# EAGLE board kicker (EAGLE 9.6.2)
VERSION: v4.0
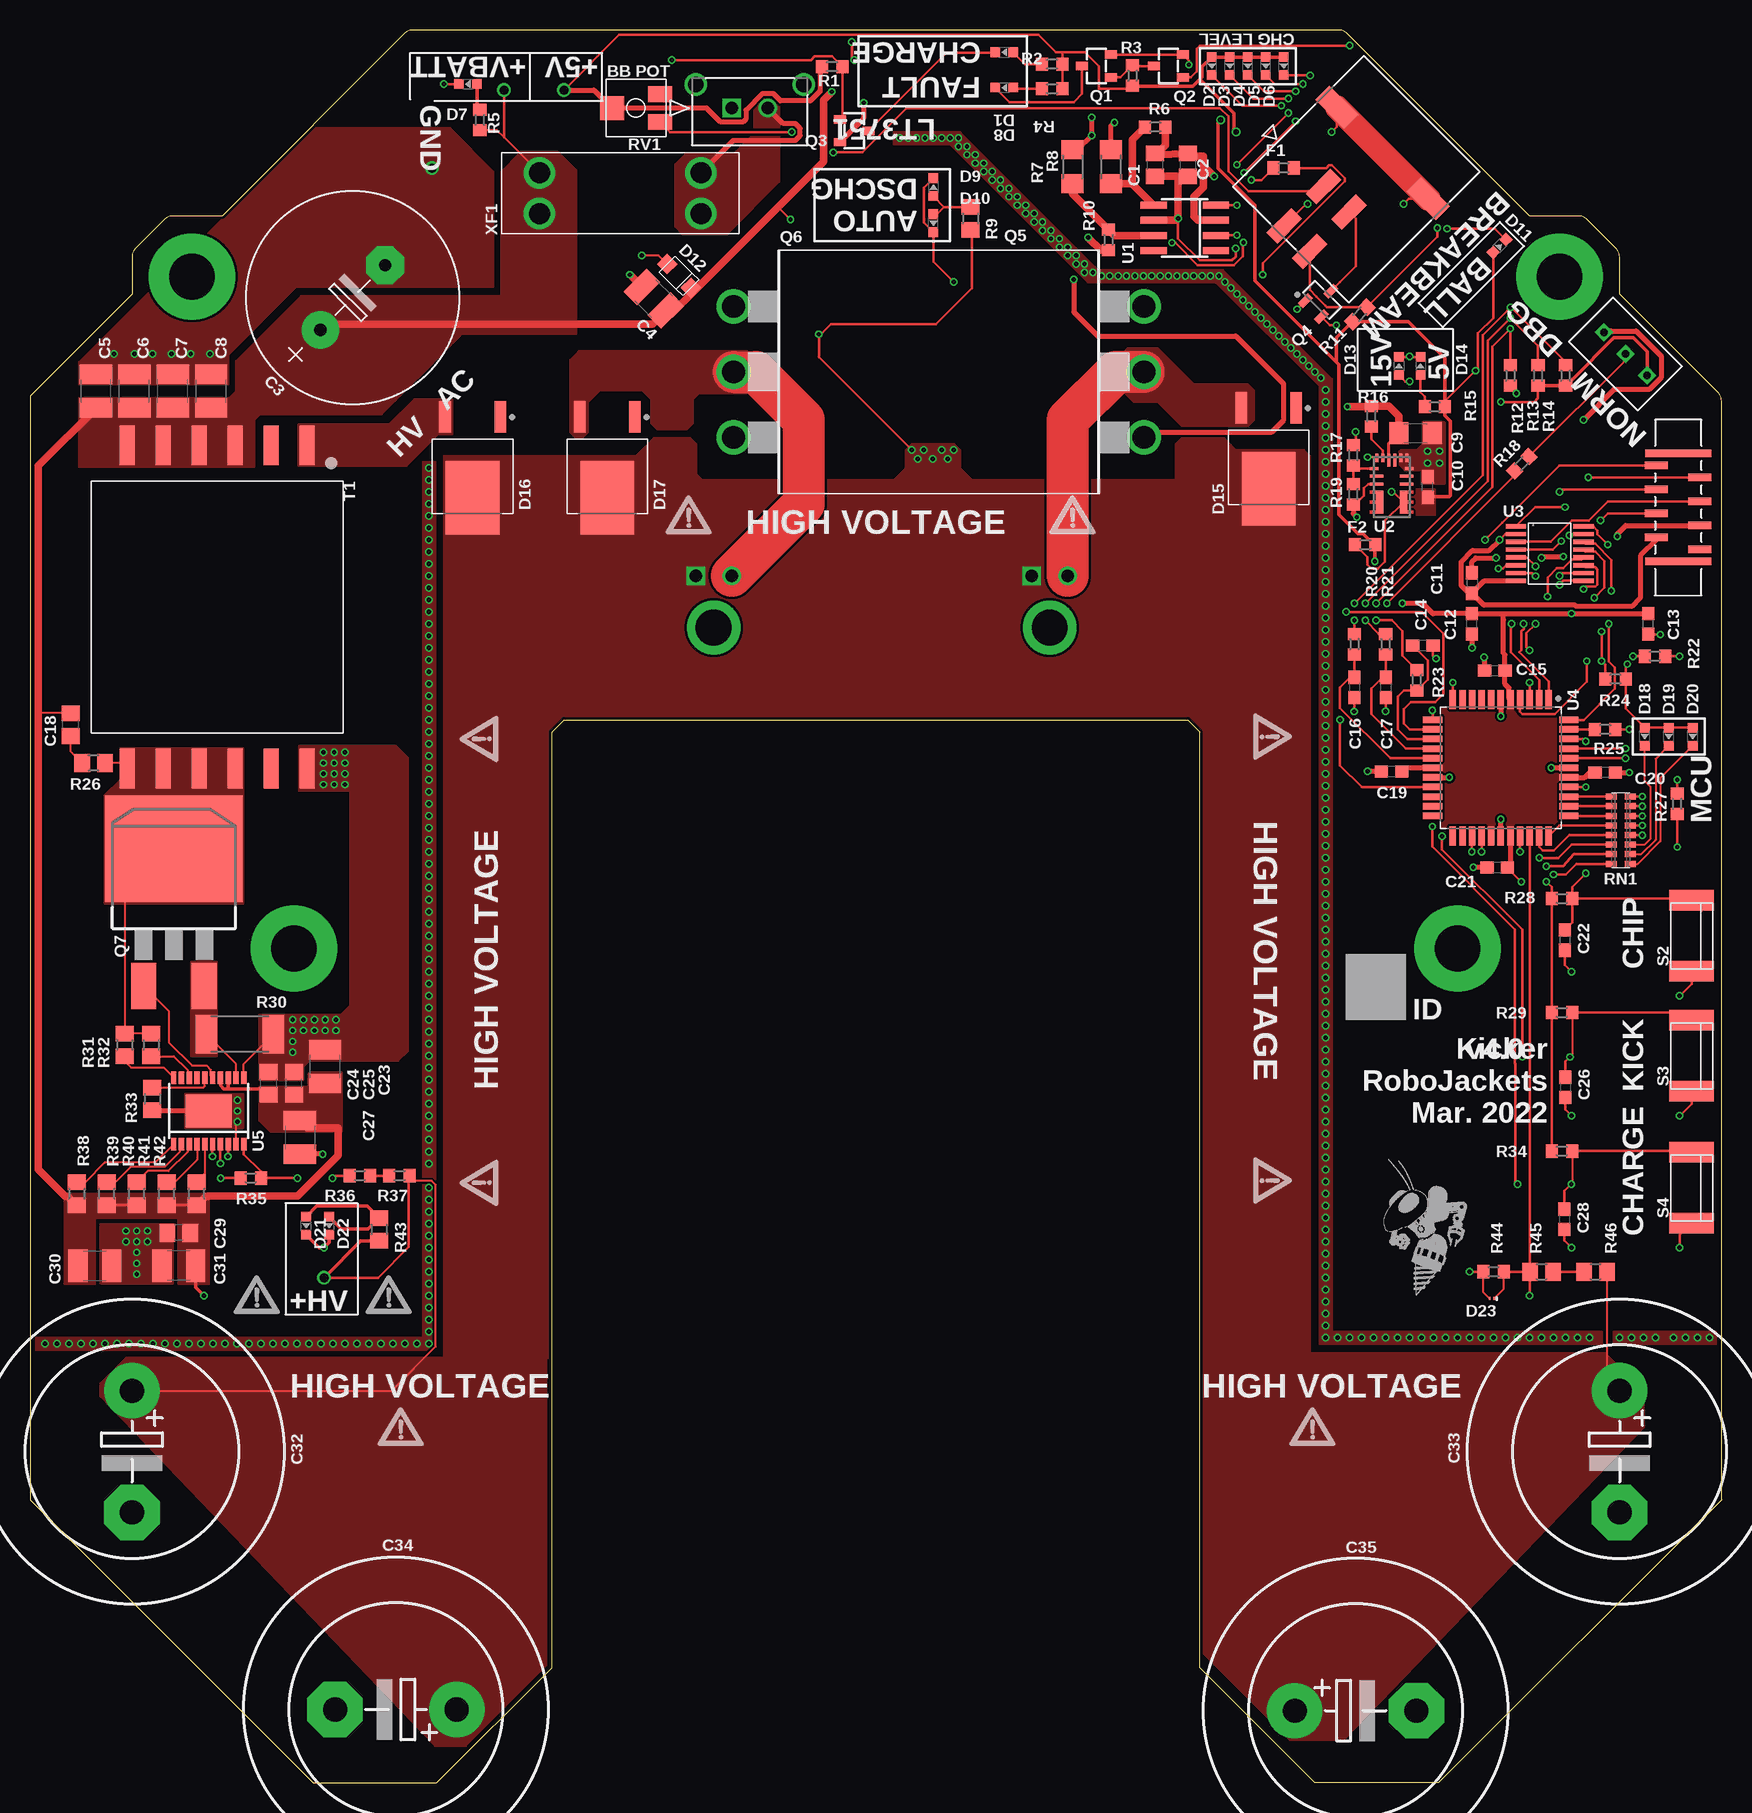
[diagram p9: board, top side]
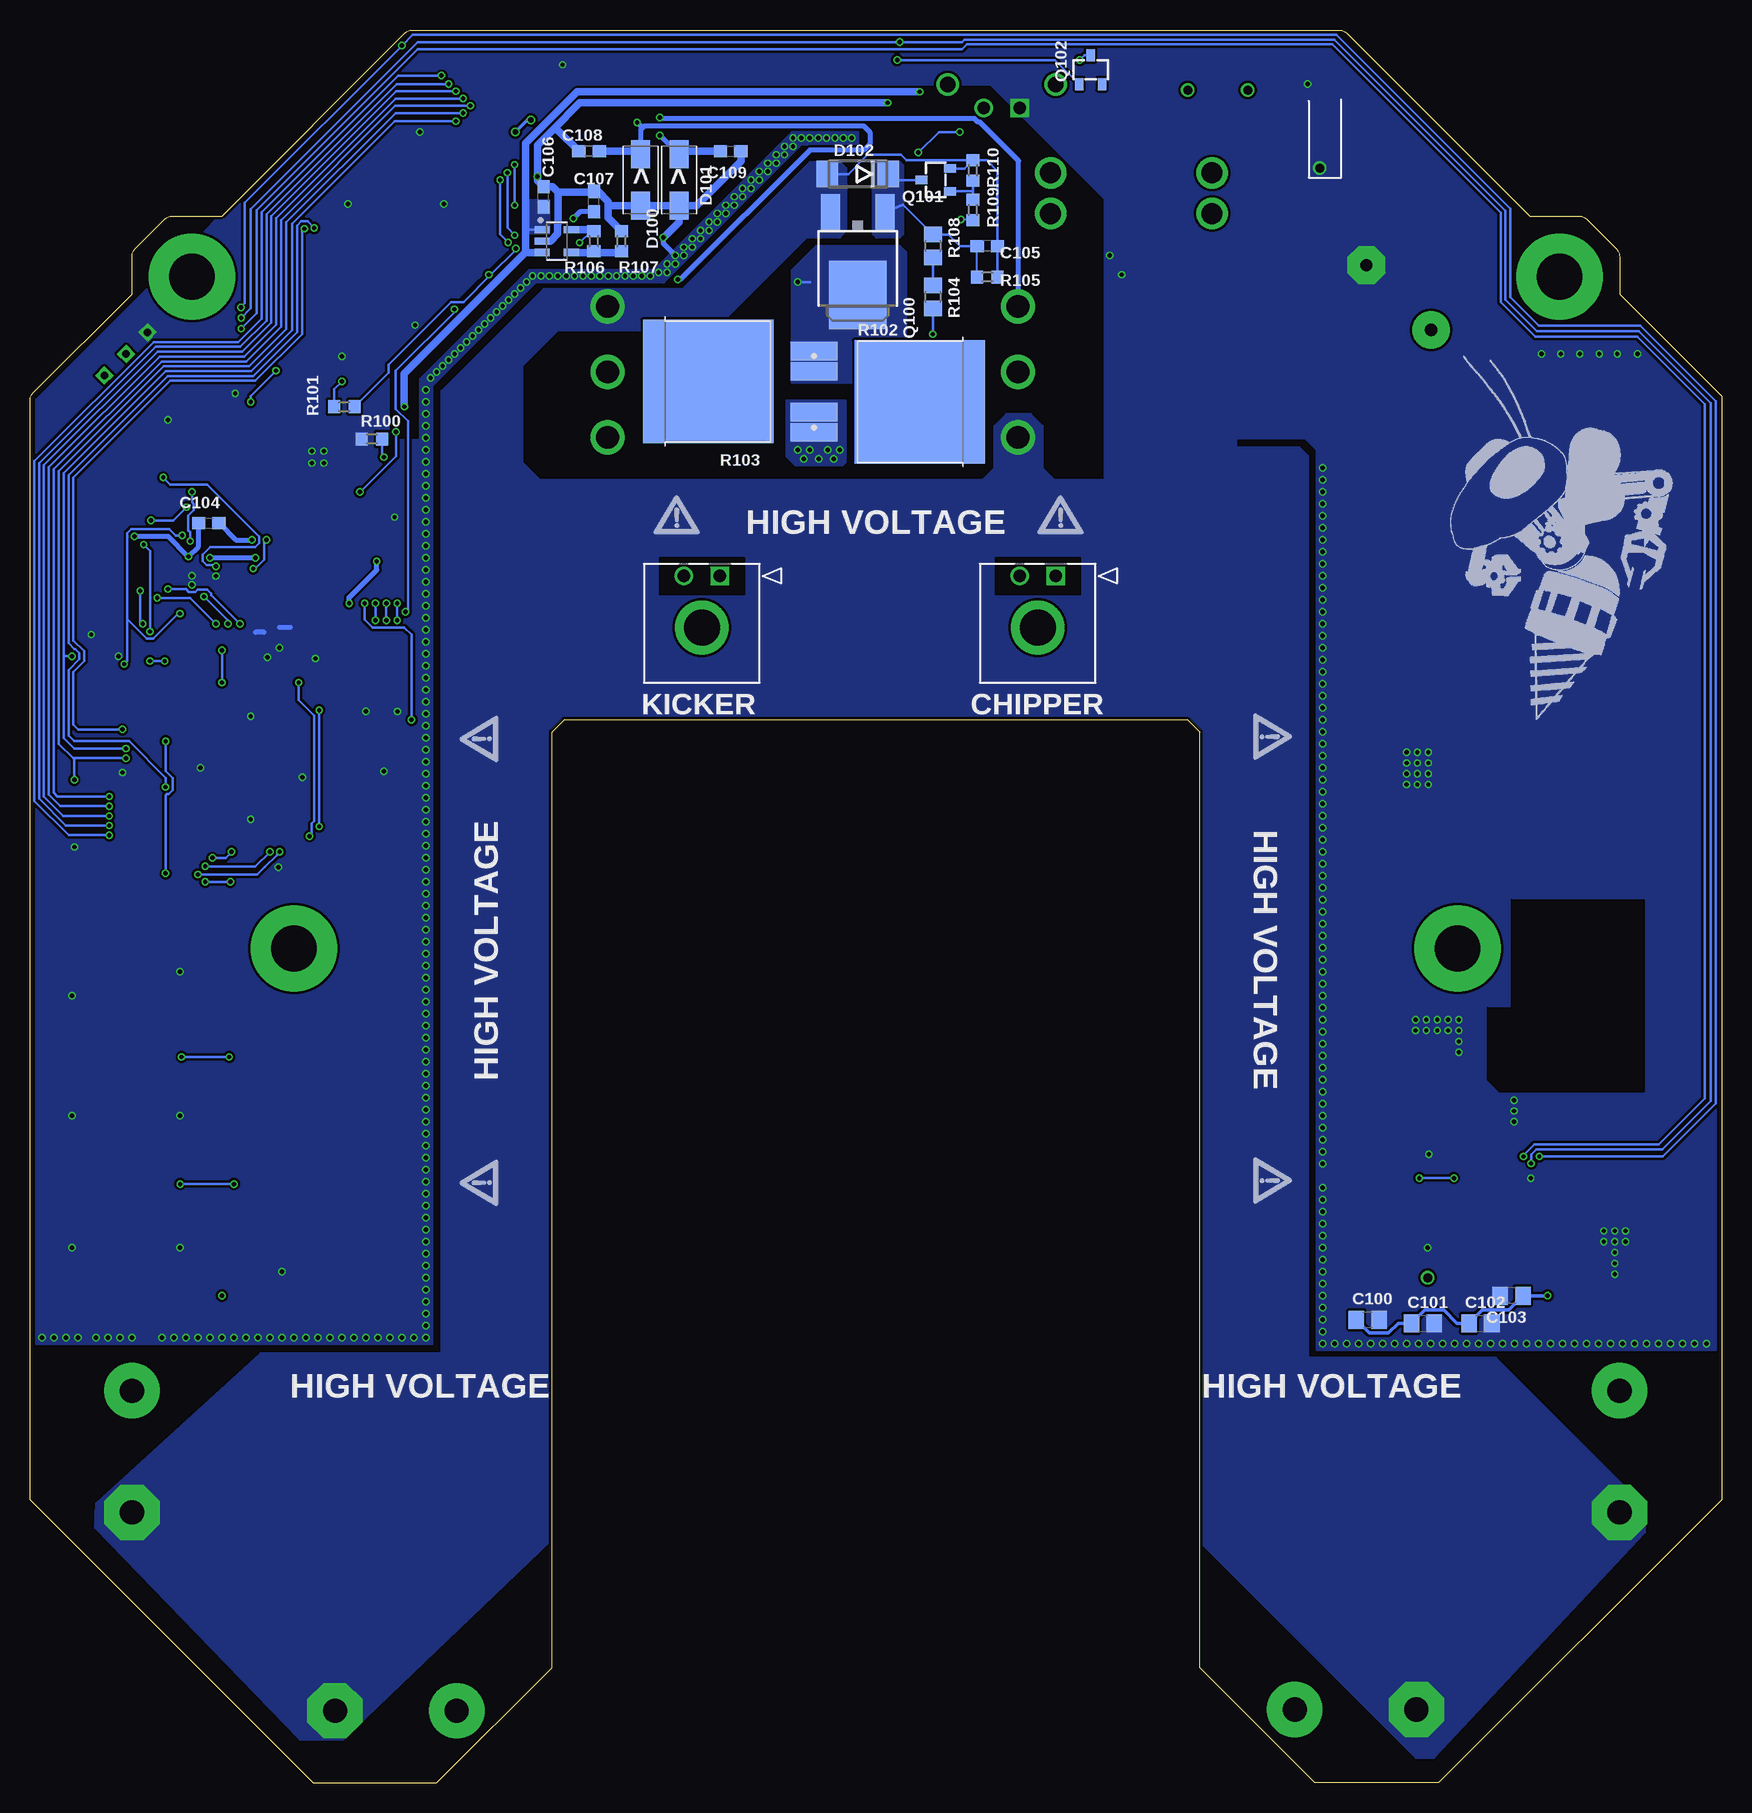
[diagram p10: board, bottom side, seen from below]

Size 141 x 146.1 mm. Coordinates in mm from the lower left corner, seen from the top.
Outline: 44.5,88.6 96.5,88.6 97.5,87.6 97.5,9.6 107.1,0 117.4,0 141,23.6 141,115.19 arc45 140.71,115.89 132.5,124.1 132.5,127.19 arc45 132.21,127.89 129.79,130.31 arc45 129.09,130.6 125,130.6 109.79,145.81 arc45 109.09,146.1 31.91,146.1 arc45 31.21,145.81 16,130.6 11.91,130.6 arc45 11.21,130.31 8.79,127.89 arc45 8.5,127.19 8.5,124.1 0,115.6 0,23.6 23.6,0 33.9,0 43.5,9.6 43.5,87.6 44.5,88.6
Copper layers (1*16): Top 0.018mm / dielectric 1.55mm / Bottom 0.018mm
Design rules "eC_2Layer_PClass6_BaseCopperO18_eCDefault": minimum track width 0.15mm, minimum drill 0.35mm, track to track 0.15mm, track to pad 0.15mm, pad to pad 0.15mm, via to via 0.15mm, smd to smd 0mil, copper to edge 0.25mm, drill to drill 0.35mm, minimum pad ring 0.175mm, minimum via ring 0.125mm, stop-mask expansion 0mil, vias tented up to drill 0.45mm, thermal gap 0.2mm
Net classes: 0 default: clearance 0.205 mm
vRestrict: area 18.2,65.8 to 25.8,73.3; area 115.2,65.8 to 122.8,73.3; area 9.8,121.8 to 17.2,129.3; area 123.8,121.8 to 131.2,129.3

## Footprints (pad centres in the part's own frame; a part is rotated, then mirrored left to right if it is on the bottom)
C0805 = smd 1.3 x 1.5: 1 -0.95,0; 2 0.95,0
E7,5-18 = drill 1.016 pad 3.15: + -3.81,0 | drill 1.016 pad 3.15 octagon: - 3.81,0
C1210 = smd 1.6 x 2.7: 1 -1.4,0; 2 1.4,0
C1206 = smd 1.6 x 1.8: 1 -1.4,0; 2 1.4,0
C0603 = smd 1.1 x 1: 1 -0.85,0; 2 0.85,0
EB25D = drill 2.007 pad 4.597: + -5.08,0 | drill 2.007 pad 4.597 octagon: - 5.08,0
CHIP-LED0603 = smd 0.8 x 0.8: A 0,-0.75; C 0,0.75
SOD123-W = smd 1.2 x 1.2: A 1.4,0; C -1.4,0
TO460P990X239-3 = smd 2.634 x 0.974: 1 -4.241,2.3; 2 -4.241,-2.3 | smd 6.101 x 4.492: 3 2.507,0
DSN0603-2 = smd 0.15 x 0.25: C1 -0.2,0; C2 0.2,0
RESM5226X262 = smd 2.316 x 1.565: 1 -2.141,0; 2 2.141,0
DO214AA = smd 1.8 x 2.2: A 2.55,0; C -2.55,0
F0603 = smd 1 x 1.1: 1 -0.85,0; 2 0.85,0
CON_436500217_MOL = drill 1.016 pad 1.524 square: 1 0,0 | drill 1.016 pad 1.524: 2 -2.997,0 | drill 1.27 pad 1.27: M1 2.997,-1.956; M2 -5.994,-1.956
CON_430450411_MOL = smd 1.27 x 2.92: 1 1.5,5.115; 2 -1.5,5.115; 3 1.5,9.745; 4 -1.5,9.745 | smd 3.43 x 1.65: S1 5.375,-0.355; S2 -5.395,-0.355
CON8_1X8_UB_SFW_JAE = smd 0.61 x 1.905: 1 0,0; 2 1,3.65; 3 2,0; 4 3,3.65; 5 4,0; 6 5,3.65; 7 6,0; 8 7,3.65 | smd 0.61 x 5.512: NC1 -1,1.803; NC2 8,1.803
CON_436500202_MOL = drill 1.016 pad 1.524 square: 1 0,0 | drill 1.016 pad 1.524: 2 -2.997,0 | drill 2.997 pad 2.997: M1 -1.499,-4.318
SOT-23-3 = smd 0.7 x 1: 1 -0.95,-1.2; 2 0.95,-1.2; 3 0,1.2
SOT95P240X110-3 = smd 1.18 x 0.609: 1 -1.024,0.95; 2 -1.024,-0.95; 3 1.024,0
TO264 = drill 1.905: C_BOT 0,-6.35; E_BOT 5.461,-6.35; G_BOT -5.461,-6.35
D2PAK = smd 2.083 x 3.81: 1 -2.54,-8.89; 3 2.54,-8.89 | smd 11.43 x 8.89: 2 0,2.54
DPAK = smd 1.6 x 3: 1 -2.28,-5.31; 3 2.28,-5.31 | smd 4.826 x 5.715: 4 0,1.588
R0603 = smd 1 x 1.1: 1 -0.85,0; 2 0.85,0
R1206 = smd 1.6 x 1.803: 1 -1.422,0; 2 1.422,0
R0805 = smd 1.3 x 1.5: 1 -0.95,0; 2 0.95,0
R2512 = smd 1.8 x 3.2: 1 -2.8,0; 2 2.8,0
TO508P1539X450-3 = smd 3.912 x 1.572: 1 -6.145,2.54; 2 -6.145,-2.54 | smd 10.892 x 10.272: 3 2.655,0
RA-8_2506 = smd 0.5 x 0.9: 1 -2.8,-0.8; 2 -2,-0.8; 3 -1.2,-0.8; 4 -0.4,-0.8; 5 0.4,-0.8; 6 1.2,-0.8; 7 2,-0.8; 8 2.8,-0.8; 9 2.8,0.8; 10 2,0.8; 11 1.2,0.8; 12 0.4,0.8; 13 -0.4,0.8; 14 -1.2,0.8; 15 -2,0.8; 16 -2.8,0.8
3214J = smd 1.3 x 2: P$1 1.15,-2; P$3 -1.15,-2 | smd 2 x 2: P$2 0,2
TT11EGPC1 = drill 0.6 pad 1.09 square: 1 -2.54,0; 2 2.54,0; 3 0,0
KSS32 = smd 1.7 x 3.7: 1 -2.95,0; 2 2.95,0
DA2034 = smd 3.3 x 1.27: 1 -13.46,7.5; 2 -13.46,4.5; 3 -13.46,1.5; 4 -13.46,-1.5; 5 -13.46,-4.5; 6 -13.46,-7.5; 7 13.46,-7.5; 8 13.46,-4.5; 9 13.46,-1.5; 10 13.46,1.5; 11 13.46,4.5; 12 13.46,7.5
SOIC-8 = smd 0.6 x 2.2: 1 -1.905,-2.6; 2 -0.635,-2.6; 3 0.635,-2.6; 4 1.905,-2.6; 5 1.905,2.6; 6 0.635,2.6; 7 -0.635,2.6; 8 -1.905,2.6
MPM3620GQV-P = smd 0.7 x 0.25: 1 -1.45,1.55; 12 1.45,1.55 | smd 1.1 x 0.25: 2 -1.25,0.9; 3 -1.25,0.25; 10 1.25,0.25; 11 1.25,0.9 | smd 0.25 x 0.7: 13 1.25,2.45; 14 0.75,2.45; 17 -0.75,2.45; 18 -1.25,2.45 | smd 0.25 x 1.1: 15 0.25,2.25; 16 -0.25,2.25 | smd 0.6 x 1.95: 456 -1,-1.25; 789 1,-1.25
PW16 = smd 1.676 x 0.356: 1 -2.819,2.275; 2 -2.819,1.625; 3 -2.819,0.975; 4 -2.819,0.325; 5 -2.819,-0.325; 6 -2.819,-0.975; 7 -2.819,-1.625; 8 -2.819,-2.275; 9 2.819,-2.275; 10 2.819,-1.625; 11 2.819,-0.975; 12 2.819,-0.325; 13 2.819,0.325; 14 2.819,0.975; 15 2.819,1.625; 16 2.819,2.275
QFP80P1200X1200X120-44 = smd 1.6 x 0.547: 1 -5.681,4; 2 -5.681,3.2; 3 -5.681,2.4; 4 -5.681,1.6; 5 -5.681,0.8; 6 -5.681,0; 7 -5.681,-0.8; 8 -5.681,-1.6; 9 -5.681,-2.4; 10 -5.681,-3.2; 11 -5.681,-4; 23 5.681,-4; 24 5.681,-3.2; 25 5.681,-2.4; 26 5.681,-1.6; 27 5.681,-0.8; 28 5.681,0; 29 5.681,0.8; 30 5.681,1.6; 31 5.681,2.4; 32 5.681,3.2; 33 5.681,4 | smd 0.547 x 1.6: 12 -4,-5.681; 13 -3.2,-5.681; 14 -2.4,-5.681; 15 -1.6,-5.681; 16 -0.8,-5.681; 17 0,-5.681; 18 0.8,-5.681; 19 1.6,-5.681; 20 2.4,-5.681; 21 3.2,-5.681; 22 4,-5.681; 34 4,5.681; 35 3.2,5.681; 36 2.4,5.681; 37 1.6,5.681; 38 0.8,5.681; 39 0,5.681; 40 -0.8,5.681; 41 -1.6,5.681; 42 -2.4,5.681; 43 -3.2,5.681; 44 -4,5.681
TSSOP-20_EP = smd 1.05 x 0.45: 1 -2.775,2.925; 2 -2.775,2.275; 3 -2.775,1.625; 4 -2.775,0.975; 5 -2.775,0.325; 6 -2.775,-0.325; 7 -2.775,-0.975; 8 -2.775,-1.625; 9 -2.775,-2.275; 10 -2.775,-2.925; 11 2.775,-2.925; 12 2.775,-2.275; 13 2.775,-1.625; 14 2.775,-0.975; 15 2.775,-0.325; 16 2.775,0.325; 17 2.775,0.975; 18 2.775,1.625; 19 2.775,2.275; 20 2.775,2.925 | smd 2.74 x 3.86: PAD 0,0
SOT95P280X145-5 = smd 1.259 x 0.609: 1 -1.228,0.95; 2 -1.228,0; 3 -1.228,-0.95; 4 1.228,-0.95; 5 1.228,0.95
3557-2 = drill 1.75: 1 -6.735,1.7; 2 -6.735,-1.7; 3 6.735,-1.7; 4 6.735,1.7

## Placement (x,y rotation side)
C1  22uF 35V  [C0805]  93.75,134.85 270 top
C2  0.1uF 35V  [C0805]  96.5,134.85 270 top
C3  560uF  [E7,5-18]  26.9,123.8 45 top
C4  10uF  [C1210]  52,123.7 135 top
C5  10uF  [C1210]  5.5,116 90 top
C6  10uF  [C1210]  8.7,116 90 top
C7  10uF  [C1210]  11.9,116 90 top
C8  10uF  [C1210]  15.1,116 90 top
C9  10uF 50V  [C1206]  115.5,112.5 0 top
C10  22uF 10V  [C0603]  116.5,108 90 top
C11  0.1uF  [C0603]  120.2,100 270 top
C12  0.1uF  [C0603]  120.2,96.6 90 top
C13  0.1uF  [C0603]  134.9,96.6 90 top
C14  1uF  [C0603]  116.1,94.8 0 top
C15  0.1uF  [C0603]  122.1,92.7 0 top
C16  1uF  [C0603]  110.4,91.3 270 top
C17  1uF  [C0603]  113,91.3 270 top
C18  220pF 100V  [C0805]  3.4,88.2 90 top
C19  0.1uF  [C0603]  113.5,84.3 0 top
C20  0.1uF  [C0603]  131.3,84.2 180 top
C21  0.1uF  [C0603]  122.3,76.3 0 top
C22  0.1uF  [C0603]  127.94,70.24 270 top
C23  10uF (X7R) 35V  [C1210]  24.6,59.7 90 top
C24  0.1uF 35V  [C0805]  19.9,58.3 90 top
C25  0.1uF 35V  [C0805]  22,58.3 90 top
C26  0.1uF  [C0603]  127.98,57.96 270 top
C27  10uF (X7R) 35V  [C1210]  22.5,53.8 270 top
C28  0.1uF  [C0603]  127.9,46.96 270 top
C29  0.1uF 35V  [C0805]  12.4,45.85 180 top
C30  10uF (X7R) 35V  [C1210]  5.4,43.1 0 top
C31  10uF (X7R) 35V  [C1210]  12.4,43.1 180 top
C32  820uF  [EB25D]  8.5,27.6 270 top
C33  820uF  [EB25D]  132.5,27.6 270 top
C34  820uF  [EB25D]  30.5,6.1 180 top
C35  820uF  [EB25D]  110.5,6 0 top
C100  0.1uF 35V  [C0805]  29.5,38.6 0 bottom
C101  1uF 35V  [C0805]  24.9,38.3 0 bottom
C102  1uF 35V  [C0805]  20.1,38.3 0 bottom
C103  0.1uF 35V  [C0805]  17.5,40.6 180 bottom
C104  0.1uF  [C0603]  126.1,105 0 bottom
C105  0.1uF 35V  [C0603]  61.2,128.1 180 bottom
C106  1uF 50V  [C0603]  98.2,132.2 90 bottom
C107  2.2uF 35V  [C0603]  94,131.8 90 bottom
C108  0.1uF 35V  [C0603]  94.4,136 180 bottom
C109  0.1uF 35V  [C0603]  82.6,136 0 bottom
D1  GREEN  [CHIP-LED0603]  81.2,144.25 90 top
D2  RED  [CHIP-LED0603]  98.5,143.1 180 top
D3  RED  [CHIP-LED0603]  100,143.1 180 top
D4  YELLOW  [CHIP-LED0603]  101.5,143.1 180 top
D5  YELLOW  [CHIP-LED0603]  103,143.1 180 top
D6  GREEN  [CHIP-LED0603]  104.5,143.1 180 top
D7  GREEN  [CHIP-LED0603]  36.5,141.6 90 top
D8  RED  [CHIP-LED0603]  81.2,141.3 90 top
D9  YELLOW  [CHIP-LED0603]  75.3,133 0 top
D10  YELLOW  [CHIP-LED0603]  75.3,130 180 top
D11  BLUE  [CHIP-LED0603]  122.5,128.1 315 top
D12  PTVS20VS1UR  [SOD123-W]  54.1,125.6 135 top
D13  GREEN  [CHIP-LED0603]  114.1,118.1 0 top
D14  GREEN  [CHIP-LED0603]  115.9,118.1 0 top
D15  GD10MPS12E  [TO460P990X239-3]  103.25,110.35 270 top
D16  GD10MPS12E  [TO460P990X239-3]  36.9,109.6 270 top
D17  GD10MPS12E  [TO460P990X239-3]  48.12,109.6 270 top
D18  GREEN  [CHIP-LED0603]  134.6,87.2 180 top
D19  YELLOW  [CHIP-LED0603]  136.6,87.2 180 top
D20  RED  [CHIP-LED0603]  138.6,87.2 180 top
D21  ORANGE  [CHIP-LED0603]  23.02,46.43 180 top
D22  ORANGE  [CHIP-LED0603]  24.94,46.43 180 top
D23  PESD4V0Y1BSFYL  [DSN0603-2]  121.86,40.36 180 top
D100  SMA6J18A  [RESM5226X262]  90.1,133.6 90 bottom
D101  SMA6J18A  [RESM5226X262]  86.9,133.6 90 bottom
D102  3SMBJ5929B-TP  [DO214AA]  72,134.1 180 bottom
F1  28 mA  [F0603]  104.5,134.6 0 top
F2  1A  [F0603]  111.3,103.2 0 top
J1  436500217  [CON_436500217_MOL]  58.5,139.6 180 top
J2  430450411  [CON_430450411_MOL]  112.5,135.6 135 top
J3  SFW8S-2STE1LF  [CON8_1X8_UB_SFW_JAE]  139.2,102.8 90 top
J100  436500202  [CON_436500202_MOL]  83.5,100.6 0 bottom
J101  436500202  [CON_436500202_MOL]  55.5,100.6 0 bottom
Q1  BSS127  [SOT-23-3]  88.9,143.1 90 top
Q2  BSS127  [SOT-23-3]  94.9,143.1 90 top
Q3  BSS127  [SOT-23-3]  68.7,137.7 270 top
Q4  BSS806NSOT-23-3  [SOT95P240X110-3]  107.7,123.6 45 top
Q5  IXYH55N120A4  [TO264]  65,117.6 270 top
Q6  IXYH55N120A4  [TO264]  86.5,117.6 90 top
Q7  IRFS4227  [D2PAK]  12,75.3 0 top
Q100  AOD1N60  [DPAK]  72,125.6 180 bottom
Q101  BSS127  [SOT-23-3]  65.5,133.6 90 bottom
Q102  BSS127  [SOT-23-3]  52.59,142.78 0 bottom
R1  1k  [R0603]  66.86,143.04 180 top
R2  330  [R0603]  85.2,143.25 0 top
R3  1k  [R0603]  91.9,142.3 270 top
R4  330  [R0603]  85.2,141.2 0 top
R5  1k  [R0603]  37.5,138.6 270 top
R6  10k  [R0603]  93.8,138 180 top
R7  100  [R1206]  86.9,134.7 90 top
R8  100  [R1206]  90.1,134.7 90 top
R9  ERJ-P06J140V  [R0805]  78.4,130.4 270 top
R10  10k  [R0603]  89.9,128.6 90 top
R11  10k  [R0603]  110.85,122.4 225 top
R12  10k  [R0603]  123.4,117.3 90 top
R13  10k  [R0603]  125.7,117.3 270 top
R14  10k  [R0603]  128,117.3 270 top
R15  330  [R0603]  117.1,114.7 0 top
R16  100k  [R0603]  111.8,113.9 270 top
R17  160k 1%  [R0603]  110.3,110.65 90 top
R18  10k  [R0603]  124.35,109.95 225 top
R19  30.1k 1%  [R0603]  110.3,107.4 90 top
R20  100  [R0603]  110.4,94.9 90 top
R21  100  [R0603]  113,94.9 90 top
R22  10k  [R0603]  135.45,93.9 0 top
R23  100  [R0603]  115.6,91.9 90 top
R24  10k  [R0603]  132.15,92 0 top
R25  160  [R0603]  131.3,87.8 180 top
R26  22  [R0805]  5.3,85 180 top
R27  10k  [R0603]  137.3,81.6 90 top
R28  10k  [R0603]  127.7,73.7 180 top
R29  10k  [R0603]  127.7,64.2 180 top
R30  11m 0.1% >1W  [R2512]  17.5,62.4 180 top
R31  11.5k 0.1%  [R0805]  7.9,61.5 270 top
R32  25.5k 0.1%  [R0805]  10.1,61.5 270 top
R33  898 0.1%  [R0805]  10.2,57 270 top
R34  10k  [R0603]  127.7,52.65 180 top
R35  336 0.1%  [R0603]  18.4,50.4 180 top
R36  340k 0.1%  [R0603]  27.5,50.6 180 top
R37  384k 0.1%  [R0603]  30.8,50.6 180 top
R38  25.5k 1%  [R0805]  3.9,49.1 270 top
R39  294k 1%  [R0805]  6.4,49.1 90 top
R40  412k 1%  [R0805]  8.9,49.1 90 top
R41  294k 1%  [R0805]  11.4,49.1 90 top
R42  412k 1%  [R0805]  13.9,49.1 90 top
R43  ERJ-P06J140V  [R0805]  29.1,46.12 270 top
R44  149K 0.1%  [R0603]  122,42.6 0 top
R45  5.05M 0.1%  [R0805]  126,42.6 0 top
R46  5.05M 0.1%  [R0805]  130.5,42.6 0 top
R100  43.2k 1%  [R0603]  112.5,112 0 bottom
R101  1k  [R0603]  114.8,114.7 0 bottom
R102  1.0k 3.5W  [TO508P1539X450-3]  69.5,115.1 0 bottom
R103  1.0k 3.5W  [TO508P1539X450-3]  81.8,116.8 180 bottom
R104  ERJ-6GEYJ515V  [R0805]  65.75,123.85 270 bottom
R105  ERJ-6GEYJ106V  [R0603]  61.2,125.5 180 bottom
R106  110k 1%  [R0603]  94,128.5 90 bottom
R107  10k 1%  [R0603]  91.7,128.5 270 bottom
R108  ERJ-6GEYJ515V  [R0805]  65.75,128.1 270 bottom
R109  100k  [R0603]  62.4,131.1 270 bottom
R110  100k  [R0603]  62.4,134.4 270 bottom
RN1  330  [RA-8_2506]  132.6,79.4 90 top
RV1  200  [3214J]  50.5,139.6 90 top
S1  TT11EGPC1  [TT11EGPC1]  133,119.1 135 top
S2  KSS32  [KSS32]  138.5,70.6 90 top
S3  KSS32  [KSS32]  138.5,60.6 90 top
S4  KSS32  [KSS32]  138.5,49.6 90 top
T1  DA203X-ALDA2034  [DA2034]  15.6,98 270 top
U1  IX4427N  [SOIC-8]  96.25,129.6 90 top
U2  MPM3620GQV-P  [MPM3620GQV-P]  113.5,108 0 top
U3  TXB0106PWR  [PW16]  126.68,102.46 0 top
U4  AT32ATQFP44  [QFP80P1200X1200X120-44]  122.6,84.6 270 top
U5  LT3751FE  [TSSOP-20_EP]  14.9,56 90 top
U100  15V  [SOT95P280X145-5]  97.1,128.5 0 bottom
U$1  [WARNING2]  53,104.1 0 top
U$2  [WARNING2]  85,104.1 0 top
U$3  [WARNING2]  102,89.1 270 top
U$4  [WARNING2]  39,85.1 90 top
U$5  [WARNING2]  102,52.1 270 top
U$6  [WARNING2]  39,48.1 90 top
U$7  [ROBOBUZZ_0.6X]  115.5,40.6 0 top
U$8  [WARNING2]  17,39.1 0 top
U$9  [WARNING2]  28,39.1 0 top
U$10  [WARNING2]  29,28.1 0 top
U$11  [WARNING2]  105,28.1 0 top
U$100  [WARNING2]  102,48.1 90 bottom
U$101  [WARNING2]  39,52.1 270 bottom
U$102  [WARNING2]  102,85.1 90 bottom
U$103  [ROBOBUZZ_1.4X]  15.5,88.6 0 bottom
U$104  [WARNING2]  39,89.1 270 bottom
U$105  [WARNING2]  89,104.1 0 bottom
U$106  [WARNING2]  57,104.1 0 bottom
XF1  10A  [3557-2]  49.2,132.5 180 top

## Tracks (layer width: path | path; a pad name or v marks a point on that pad's centre or on a via)
15V_PWR_BR  (via drill 0.35)
  Top 0.2: v115,116.8 114.65,116.8 D13.A
  Bottom 0.2: v115,116.8 115.65,116.14 R101.1
15V_PWR_BR1
  Top 0.3: R5.1 37.25,139.7 D7.A
!BTN_CHG  (via drill 0.35)
  Top 0.152: R34.1 128.55,49.98 v128.47,49.9
  Top 0.2: U4.12 116.92,89.38 v116.9,89.4 | v116.9,79.7 116.9,78.03 123.79,71.14 123.79,59.95 123.8,59.94 123.8,50.1 v124,49.9 | S4.2 138.4,52.65 R34.1 | C28.1 127.9,49.33 v128.47,49.9
  Bottom 0.2: v116.9,89.4 v116.9,79.7 | v124,49.9 v128.47,49.9
!BTN_CHP  (via drill 0.35)
  Top 0.2: R28.1 138.95,73.7 139.3,73.35 139.3,72.65 S2.2 | v129.68,86.8 129.49,87 U4.42 | R28.1 128.55,74.65 v129.7,75.8 | C22.1 128.55,71.7 R28.1
  Bottom 0.2: v129.68,86.8 129.68,84.31 129.09,83.73 129.09,82.75 129.45,82.39 129.6,82.39 129.7,82.3 v129.7,75.8
!BTN_KCK  (via drill 0.35)
  Top 0.152: R29.1 128.55,60.68 v128.37,60.5
  Top 0.2: U4.11 v118.6,91.7 | v124.4,60.5 124.4,71.1 117.7,77.8 v117.7,78.9 | S3.2 138.48,63.55 137.9,64.2 R29.1 | C26.1 127.98,60.11 v128.37,60.5
  Bottom 0.2: v118.6,91.7 118.6,90.24 117.31,88.95 117.31,80.15 117.5,79.95 117.5,79.09 v117.7,78.9 | v124.4,60.5 v128.37,60.5
!CS_KICKER_EXT
  Top 0.2: J3.5 131.5,106.8 129.92,105.22 128.53,105.22 126.75,103.44 U3.3
!DONE!
  Top 0.2: U4.15 114.7,86.2 111.8,89.1 111.8,91.2 112.75,92.15 C17.1 R21.1
!DONE!_RAW  (via drill 0.35)
  Top 0.2: v15.87,51.63 U5.7 | R21.2 112.45,95.75 v111.3,96.9 | v111.3,98.3 121.5,108.5 121.5,120.2 v123.4,122.1 125.7,119.8 R13.1 | v68.72,143.6 68.5,143.81 v68.5,145.1
  Bottom 0.2: v15.87,51.63 15.87,52.39 15.45,52.8 14.95,52.8 14.94,52.8 4.95,52.8 0.9,56.85 0.9,115 6.9,121 15.4,121 18.01,123.61 18.01,131.04 32.27,145.3 63.12,145.3 63.33,145.1 v68.5,145.1 108.67,145.1 122.6,131.18 122.6,122.9 v123.4,122.1 | v111.3,96.9 v111.3,98.3 | Q102.1 55.56,143.6 v68.72,143.6
!FAULT!
  Top 0.2: U4.16 113.4,85.4 109.2,89.6 109.2,91.3 110.05,92.15 C16.1 R20.1
!FAULT!_RAW  (via drill 0.35)
  Top 0.2: v15.2,52.2 15.2,53.2 U5.6 | Q2.1 96.75,142.15 97.25,142.65 97.25,144.55 97.5,144.8 v110,144.8 | R20.2 v110.4,96.9 | v110.4,98.3 121.1,109 121.1,120.6 121.1,120.66 123.15,122.7 v123.42,122.98 128,118.4 R14.1
  Bottom 0.2: v15.2,52.2 4.9,52.2 0.49,56.61 0.49,115.18 6.77,121.45 15.23,121.45 17.6,123.82 17.6,131.2 32.1,145.7 109.09,145.7 v110,144.8 123.08,131.72 123.08,123.32 v123.42,122.98 | v110.4,96.9 v110.4,98.3
!KICKER_SELECT  (via drill 0.35)
  Top 0.2: U4.44 129.5,88.6 132.1,91.2 132.1,92.97 131.6,93.47 v131.6,96.6 | U3.14 129.67,103.27 130.46,103.27 131.81,101.93 v131.81,99.36
  Bottom 0.2: v131.81,99.36 131.81,96.8 v131.6,96.6
!RESET  (via drill 0.35)
  Top 0.2: U4.4 124.2,89.3 124.4,89.1 127.1,89.1 129.78,91.78 v129.78,93.5 | R24.1 131.3,93.2 v131,93.5 v131,95.96 | v131.52,103.19 130.64,104.07 130.64,104.39 130.3,104.73 U3.16
  Bottom 0.2: v129.78,93.5 v131,93.5 | v131,95.96 131,102.67 v131.52,103.19
!RESET_EXT  (via drill 0.35)
  Top 0.2: J3.4 131.5,105.8 v130.92,105.22 | v127.95,106.33 125.46,106.33 U3.1
  Bottom 0.2: v130.92,105.22 129.07,105.22 v127.95,106.33
+5V  (via drill 0.35, 0.45, 0.75 pad 0.75)
  Top 0.2: D20.A D19.A D18.A 133,89.55 R24.2 133,93.1 v133.15,93.25 | R4.2 R2.2 86.05,144.25 | 86.05,144.25 85.5,144.25 84.05,145.7 49.11,145.7 v44.5,141.1 | 86.05,144.25 87.95,144.25 89.1,143.1 89.1,141.2 91.65,141.2 R3.2 | R34.2 R29.2 R28.2 126.85,74.64 v126.4,75.09 | v124.3,75.09 123.15,76.24 C21.2 | C10.1 116.55,107.2 | R15.2 117.95,115.16 v120.5,117.7 120.69,117.9 120.69,120.82 121.97,122.1 D11.A | R13.2 125.7,115.4 125.4,115.1 v122.6,115.1 | 102.1,125.19 102.1,125.2 | U3.15 128.42,104.08 v128.31,103.97
  Top 0.305: R13.2 R14.2 128.52,116.97 128.55,116.97 132.03,120.45 133.65,120.45 134.8,119.3 S1.1 | R3.2 91.95,141.4 96.95,141.4 97.52,141.98 | D6.A D5.A D4.A D3.A D2.A 97.71,143.06 97.71,142.16 97.52,141.98 | 116.55,107.2 118.3,107.2 118.4,107.3 118.4,113.5 117.95,113.95 R15.2 117.95,118.75 114.9,121.8 R11.2 108.89,120.44 108.89,118.4 | 108.89,118.4 109.1,118.19 109.1,105.7 110.69,104.11 111.1,104.11 112,103.2 | 108.89,118.4 102.1,125.19 | 102.1,125.2 102.1,131.5 99,134.6 99,138.35 v99.25,138.6 | v100.56,137.6 100.36,137.8 100.36,139.14 97.52,141.98 | 112,103.2 F2.2 | v112.1,101.8 112.1,103.1 112,103.2
  Top 0.406: 122.9,97.45 C12.2 116.95,97.45 116.1,98.3 v114.4,98.3 | 122.9,97.45 v128.5,97.45 C13.2 | 122.9,97.45 122.81,97.44 122.81,96.91 122.79,96.89 122.79,94.19 122.95,94.03 C15.2 122.95,91.58 123.28,91.25 123.28,90.4 U4.5 | U4.38 129.6,83.8 130,84.2 C20.2 | U4.29 123.4,76.55 C21.2 | C19.2 114.65,84.6 U4.17 | v44.5,141.1 47,141.1 RV1.P$2 56.4,139.6 57.57,138.43 59.43,138.43 59.67,138.67 59.67,139.43 61.01,140.77 61.98,140.77 62.56,140.19 65.06,140.19 65.86,140.99 65.86,142.88 R1.2
  Bottom 0.2: v126.4,75.09 v124.3,75.09 | v120.5,117.7 122.6,115.59 v122.6,115.1 | v128.31,103.97 128.85,103.97 129.39,104.5 132.55,104.5 132.91,104.15 132.91,97.01 | v128.5,97.45 128.66,97.45 130.75,95.36 131.25,95.36 132.91,97.01 | 132.91,97.01 132.91,93.49 v133.15,93.25
  Bottom 0.305: v99.25,138.6 99.56,138.6 v100.56,137.6
  Bottom 0.406: v114.4,98.3 114.4,98.8 112.1,101.1 v112.1,101.8
  pour Top (no thermals): 114.1,107.8 117.1,107.8 117.1,105.8 117.1,105.7 114.1,105.7
  pour Top (no thermals): 117.6,89.6 117.6,79.6 127.6,79.6 127.6,89.6
+15V  (via drill 0.35)
  Top 0.2: v100.5,127.9 100.5,127.2 100.2,126.9 97.5,126.9 95.7,128.7 v95.7,130.4 | F1.2 108.05,134.6 108.28,134.83 108.53,134.83 109.61,133.75 109.61,133.5 102.76,126.65 v102.76,125.7
  Top 0.61: C1.2 95.8,133.9 | 95.8,133.9 C2.2 | 95.8,133.9 95.7,133.8 v95.7,130.4 95.53,130.23 U1.6
  Bottom 0.2: v100.5,127.9 100.5,127.8 102.6,125.7 | R101.2 111.1,117.55 111.1,118.21 105.88,123.43 104.87,123.43 102.6,125.7 | 102.6,125.7 v102.76,125.7
  Bottom 0.406: C107.1 95.15,130.95 v95.7,130.4
BALL_SENSE
  Top 0.2: U4.43 R25.2
BALL_SENSE_CL  (via drill 0.35)
  Top 0.2: R25.1 v133.3,87.8 | v118.13,129.54 122.12,129.54 D11.C
  Bottom 0.2: v133.3,87.8 137,87.8 137.38,88.19 137.38,92.59 136.49,93.48 136.49,94.32 137.38,95.21 137.38,108.8 129.33,116.85 122.22,116.85 118.33,120.75 118.33,129.34 v118.13,129.54
BB_RX  (via drill 0.35)
  Top 0.2: v129.7,83 U4.37 | J2.4 106.67,124.45 107.24,123.88 107.24,123.86 107.96,123.14 107.97,123.14 108.12,123 R11.1 117.32,128.87 v117.32,129.6
  Bottom 0.2: v129.7,83 129.7,83.76 132.75,86.81 137.3,86.81 137.79,87.3 137.79,92.75 136.89,93.65 136.89,94.15 137.25,94.5 137.3,94.5 137.79,95 137.79,109 129.53,117.26 122.39,117.26 118.73,120.92 118.73,129.79 118.38,130.15 117.87,130.15 v117.32,129.6
BB_TX  (via drill 0.35)
  Top 0.2: U4.13 115,87.8 114.5,88.3 114.5,89.5 115.1,90.1 116.64,90.1 116.65,90.09 117.15,90.09 117.81,90.75 117.81,95.79 116,97.6 v109.7,97.6 | v105.63,122.83 105.63,122.87 Q4.1
  Bottom 0.2: v109.7,97.6 109.5,97.8 109.5,113.5 110.5,114.5 110.5,117.69 105.5,122.7 v105.63,122.83
BB_TX_CL  (via drill 0.35)
  Top 0.2: J2.1 107.45,132.67 101.57,132.67 99.9,134.35 99.9,138.9 99.2,139.6 73.08,139.6 69.38,135.89 v66.95,135.89 | v63.5,137.6 53.35,137.6 RV1.P$3
  Bottom 0.2: v66.95,135.89 65.25,137.6 v63.5,137.6
CHARGE
  Top 0.2: U4.14 114.8,87 114,87.8 114,90.55 114.5,91.05 R23.1 116.5,91.95 116.5,93.55 C14.1
CHARGE_RAW  (via drill 0.35)
  Top 0.2: v16.5,52.2 16.5,53.2 U5.8 | v112.2,96.9 113.5,96.9 114.4,96 114.4,93.95 R23.2 | v112.2,98.3 121.91,108.01 121.91,119.71 v123.4,121.2 R12.2
  Bottom 0.2: v16.5,52.2 16.5,52.33 15.62,53.21 5.24,53.21 1.4,57.05 1.4,114.9 7.02,120.52 15.52,120.52 18.41,123.41 18.41,130.87 32.44,144.89 62.91,144.89 63.3,144.5 64.14,144.5 64.15,144.5 108.69,144.5 108.7,144.5 122.1,131.1 122.1,122.5 v123.4,121.2 | v112.2,96.9 v112.2,98.3
CHIP  (via drill 0.35)
  Top 0.2: v137.5,93.9 R22.2 | v133,86.2 U4.41 | v105.5,138.5 v101.2,134.2 | v100.6,129 98.89,129 U1.2
  Bottom 0.2: 138.19,93.9 138.19,109.17 129.7,117.66 122.56,117.66 119.14,121.09 119.14,129.96 110.6,138.5 v105.5,138.5 | 138.19,93.9 138.19,87.1 137.3,86.2 v133,86.2 | 138.19,93.9 v137.5,93.9 | v101.2,134.2 v101.2,134.19 101.2,129.6 v100.6,129
CHIP_GATE
  Top 0.61: U1.7 90.39,128.97 R10.2 86.9,132.45 R7.1
CHIP_GATE_S  (via drill 0.35)
  Top 0.406: R7.2 87.32,136.12 v88.5,137.3 v88.5,138.81
  Bottom 0.406: Q5.G_BOT 58.6,123.11 58.6,135.2 61.83,138.43 61.98,138.43 62.26,138.71 88.4,138.71 v88.5,138.81 | D101.2 88.46,137.3 v88.5,137.3
  Bottom 0.61: C109.1 86.64,136 D101.2
CHIPPER
  Top 3.5: Q5.C_BOT 60.5,117.6 64.5,113.6 64.5,106.6 J101.2
  pour Top (no thermals): 45,112.6 45.5,112.1 46,112.1 46.5,112.6 46.5,115.1 47.5,116.1 51,116.1 51.75,115.35 51.75,113.35 52.25,112.85 54.75,112.85 55.25,113.35 55.25,115.35 55.75,115.85 59.75,115.85 60.5,116.6 60.5,118.6 59.75,119.35 45.75,119.35 45,118.6
CSP
  Top 0.152: U5.12 17.17,59.92 R30.2
  pour Top (no thermals): 13.4,68.4 13.4,60.6 15.6,60.6 15.6,68.4
DISCHARGE_DRAIN  (via drill 0.35)
  Top 0.2: v77,125.1 75.3,126.8 D10.C 74.5,130.05 74.5,132.95 D9.C
  Bottom 0.2: v77,125.1 76,125.1
  pour Bottom (no thermals): 68,127.6 68.5,128.1 75.5,128.1 77.5,126.1 77.5,116.7 72.5,116.7 72.5,120.6 68,120.6
FAULT_INV_BR
  Top 0.2: Q2.3 91.95,143.1 R3.1 90.9,142.15 Q1.1
FAULT_INV_BR1  (via drill 0.35)
  Top 0.2: Q3.1 67.71,138.86 R1.1 66.86,143.89 65.38,143.89 65.09,143.6 v53.5,143.6
  Bottom 0.2: Q102.3 53.12,143.98 v53.5,143.6
FB
  Top 0.2: R19.2 R17.1 110.55,109.55 U2.1
GND  (via drill 0.35, 0.75)
  Top 0.15: D23.C2 121.15,40.87 R44.1
  Top 0.152: U5.11 17.83,59.92 R30.1 | D12.A 52.4,127.3 v51,127.3 | U5.9 17.17,54.97 v17.3,55.1
  Top 0.2: R44.1 v120,42.6 | R35.2 v15.9,50.4 | Q1.2 Q2.2 96.6,143.55 v96.6,143.2 | R22.1 v133.63,93.9 | C13.1 134.95,95.7 v135.9,95.7 | R27.1 v137.3,78 | C16.2 110.4,89.3 v110.38,89.28 | C17.2 v113,89.3 | R12.1 123.4,116.3 v123.9,115.8 | v108.9,121.5 108.35,121.5 Q4.2 | D13.C 115,118.85 | 115,118.85 D14.C | v115,118.9 115,118.85 | C14.2 116.95,93.95 v117.2,93.7 | U2.3 111.55,108.25 111.2,107.9 111.2,107.3 110.45,106.55 R19.1 | S4.1 137.5,45.65 v137.5,44.6 | S3.1 138.5,56.6 v137.5,55.6 | S2.1 138.5,66.6 v137.5,65.6 | C26.2 127.98,56.12 v128.5,55.6 | C28.2 127.9,45.2 v128.5,44.6 | C22.2 127.94,68.16 v128.5,67.6 | D7.C v34.5,141.6 | J2.3 106.37,131.59 v106.49,131.59 | J2.S1 108.95,138.05 v108.5,137.6 | J2.S2 114.94,132.04 v114.5,131.6 | U3.7 125.2,100.83 125.25,100.79 125.3,100.79 v125.5,100.59 | U3.10 127.73,100.83 v127.5,100.6 | U3.9 127.83,100.19 v127.5,99.86
  Top 0.3: D22.C 24.94,45.04 v24.5,44.6 24.1,44.6 D21.C
  Top 0.406: v110.6,105.5 110.3,105.8 R19.1 | R33.2 14.85,56.05 U5.PAD | v24.4,52.4 C27.2 | U4.39 v126.8,84.6 | U4.6 v122.6,88.9 | U4.18 v118.3,83.8 | U4.28 v122.6,80.3 | C20.1 v133.3,84.2 | C19.1 v111.5,84.3 | C21.1 v120.3,76.3 | C15.1 121.25,93.75 v121.2,93.8 | C12.1 v120.2,94.6 | Q3.2 69.5,138.75 v69.5,140.03 | S1.2 131.69,120.9 131.8,121.01 133.88,121.01 135.97,118.92 135.97,117.13 134.97,116.12 132.03,116.12 v129.5,113.6
  Top 0.61: C1.1 93.85,135.7 | 93.85,135.7 C2.1 96.6,135.6 97.8,135.6 97.8,134.4 | U1.3 97.36,130.23 97,130.6 97,132.2 97.8,133 97.8,134.4 | v98.7,133.9 98.2,134.4 97.8,134.4 | R10.1 89.25,127.75 v88.2,128.8 | R6.1 94.65,136.5 93.85,135.7 | C4.2 v50,125.7
  Top 2: J2.S2 J2.S1 | J2.S1
  Bottom 0.2: Q101.2 63.1,134.55 R110.1 | R110.1 67.95,135.25 68.4,135.7 71.18,135.7 72.78,134.1 D102.A | R110.1 61.25,135.25 60.35,134.35 C105.1 R105.1
  Bottom 0.406: 121.5,95.9 122.2,95.9 | 119.3,96.3 120.2,96.3 | v87.2,127.3 88.2,128.3 v88.2,128.8
  Bottom 0.61: 97,132.6 97,129.98 97.01,129.97 97.01,129.11 97.62,128.5 U100.2 | 97,132.6 97.45,133.05 C106.2 98.7,133.55 v98.7,133.9 98.7,136.5 97.4,137.8 | R107.1 92.8,130.45 92.8,131.4 | 92.8,131.4 92.8,131.8 93.65,132.65 C107.2 94.05,132.6 97,132.6 | C109.2 81.75,135.15 85.44,131.46 D101.1 | D101.1 D100.1 92.74,131.46 92.8,131.4 | D101.1 86.9,130.1 v88.2,128.8 | C108.2 97.05,137.8 97.4,137.8 | 97.4,137.8 95.17,140.03 v69.5,140.03
  other vias: 8.9,45.1 31.25,36.6 32.25,36.6 33.25,36.6 33.25,37.6 33.25,38.6 138,37.1 132.5,37.1 133.5,37.1 140,37.1 137,37.1 139,37.1 135.5,37.1 134.5,37.1 108,37.1 109,37.1 110,37.1 111,37.1 112,37.1 113,37.1 114,37.1 115,37.1 116,37.1 117,37.1 118,37.1 119,37.1 120,37.1 121,37.1 122,37.1 123,37.1 124,37.1 125,37.1 126,37.1 127,37.1 128,37.1 129,37.1 130,37.1 108,38.1 108,39.1 108,40.1 108,41.1 108,42.1 108,43.1 108,44.1 108,45.1 108,46.1 108,47.1 108,48.1 108,49.1 108,50.1 108,51.1 108,52.1 108,53.1 108,54.1 108,55.1 108,56.1 108,57.1 108,58.1 108,59.1 108,60.1 108,61.1 108,62.1 108,63.1 108,64.1 108,65.1 108,66.1 108,67.1 108,68.1 108,69.1 108,70.1 108,71.1 108,72.1 108,73.1 108,74.1 108,75.1 108,76.1 108,77.1 108,78.1 108,79.1 108,80.1 108,81.1 108,82.1 108,83.1 108,84.1 108,85.1 108,86.1 108,87.1 108,88.1 108,89.1 108,90.1 108,91.1 108,92.1 108,93.1 108,94.1 108,95.1 108,96.1 108,97.1 108,98.1 108,99.1 108,100.1 108,101.1 108,102.1 108,103.1 108,104.1 108,105.1 108,106.1 108,107.1 108,112.1 108,111.1 108,110.1 108,109.1 108,108.1 108,113.1 108,114.1 108,115.1 108,116.1 107.6,117.1 107.1,117.6 106.6,118.1 106.1,118.6 105.6,119.1 105.1,119.6 104.6,120.1 104.1,120.6 103.6,121.1 103.1,121.6 102.6,122.1 101.6,123.1 101.1,123.6 100.6,124.1 102.1,122.6 99.1,125.6 99.6,125.1 100.1,124.6 75.3,137.1 74.6,137.1 73.9,137.1 73.2,137.1 72.5,137.1 33.25,39.6 33.25,40.6 33.25,41.6 33.25,42.6 33.25,43.6 33.25,44.6 33.25,45.6 33.25,46.6 33.25,47.6 33.25,48.6 33.25,49.6 33.25,51.6 33.25,52.6 33.25,53.6 33.25,54.6 33.25,55.6 33.25,56.6 33.25,57.6 33.25,58.6 33.25,59.6 33.25,60.6 33.25,61.6 33.25,62.6 33.25,63.6 33.25,64.6 33.25,65.6 33.25,66.6 33.25,67.6 33.25,68.6 33.25,70.6 33.25,72.6 33.25,73.6 33.25,74.6 33.25,75.6 33.25,76.6 33.25,77.6 33.25,78.6 33.25,79.6 33.25,80.6 33.25,81.6 33.25,82.6 33.25,83.6 33.25,84.6 33.25,85.6 33.25,86.6 33.25,87.6 33.25,88.6 33.25,89.6 33.25,90.6 33.25,91.6 33.25,92.6 33.25,93.6 33.25,94.6 33.25,95.6 33.25,96.6 33.25,97.6 33.25,98.6 33.25,99.6 33.25,100.6 33.25,101.6 33.25,102.6 33.25,103.6 33.25,104.6 33.25,105.6 33.25,106.6 33.25,107.6 33.25,108.6 30.25,36.6 29.25,36.6 28.25,36.6 27.25,36.6 26.25,36.6 25.25,36.6 24.25,36.6 23.25,36.6 22.25,36.6 21.25,36.6 20.25,36.6 19.25,36.6 18.25,36.6 17.25,36.6 16.25,36.6 15.25,36.6 14.25,36.6 13.25,36.6 12.25,36.6 11.25,36.6 10.25,36.6 9.25,36.6 8.25,36.6 7.25,36.6 6.25,36.6 5.25,36.6 4.25,36.6 3.25,36.6 2.25,36.6 1.25,36.6 87.9,125.9 89.3,125.6 90,125.6 95.6,125.6 94.9,125.6 94.2,125.6 90.7,125.6 91.4,125.6 93.5,125.6 92.8,125.6 92.1,125.6 116.5,111 117.5,111 117.5,110 116.5,110 33.25,69.6 86.5,127.3 85.8,128 85.1,128.7 84.4,129.4 83.7,130.1 83,130.8 82.3,131.5 81.6,132.2 80.2,133.6 79.5,134.3 78.8,135 78.1,135.7 77.4,136.4 78.1,136.4 78.8,135.7 79.5,135 80.2,134.3 80.9,133.6 82.3,132.2 83,131.5 83.7,130.8 84.4,130.1 86.5,128 85.8,128.7 85.1,129.4 76,137.1 76.7,137.1 77.4,137.1 80.9,132.9 81.6,132.9 87.2,126.6 87.9,126.6 88.6,125.9 96.3,125.6 97,125.6 97.7,125.6 98.4,125.6 24.6,63.6 25.5,63.6 25.5,62.7 24.6,62.7 23.7,62.7 23.7,63.6 22.8,63.6 22.8,62.7 21.9,62.7 21.9,63.6 21.9,61.8 21.9,60.9 17.3,56 17.3,56.9 8.9,44.2 8.9,43.3 8.9,42.4 8.9,46 9.8,46 9.8,45.1 8,45.1 8,46 33.25,71.6 24.45,85.9 24.45,85 24.45,84.1 24.45,83.2 25.35,83.2 25.35,84.1 25.35,85 25.35,85.9 26.25,85.9 26.25,85 26.25,84.1 26.25,83.2 7,119.1 10.2,119.1 13.4,119.1 11.8,119.1 8.7,119.1 15,119.1 33.25,109.6 33.5,134.6
  pour Top (no thermals): 0.5,37.1 0.5,36.1 33.75,36.1 33.75,37.1
  pour Top (no thermals): 33.75,36.1 33.75,110.1 32.75,110.1 32.75,36.1
  pour Bottom (rank 2, no thermals): 0.5,114.69 30.47,144.66 51.4,144.55 51.4,108.6 55.62,108.6 56.62,109.6 56.62,113.1 57.62,114.1 59.62,114.1 60.62,113.1 60.62,109.6 61.62,108.6 98.5,108.6 100,110.1 100,118.1 97,121.1 84,121.1 76.25,128.85 73.5,128.85 73,129.35 73,134.6 73.5,135.1 76,135.1 86.6,124.5 98.2,124.5 106.7,116 106.7,35.8 121.78,35.8 135.48,23.29 135.54,21.23 118.54,3.64 114.95,3.57 97.5,20.29 97.5,87.33 43.5,87.33 43.5,20.1 25.5,2.1 23.97,2.1 6.4,20.89 6.4,23 18.8,35.4 34.5,35.4 34.5,110.6 35.2,111.3 40.5,111.3 40.5,112.1 34.75,112.1 33.75,111.1 33.75,36.1 0.5,36.1
  pour Bottom (no thermals): 108.5,111.9 108.5,117 99.4,126.1 89,126.1 77.5,137.6 72,137.6 72,136.6 76.7,136.6 88.15,125.1 88.15,125.1 98.8,125.1 107.5,116.4 107.5,36.6 140.5,36.6 140.5,115.3 111.3,144.5 46,144.5 46,130.1 49.5,130.1 61,141.6 95.5,141.6 100.2,136.9 100.2,132.5 101.2,131.5 101.2,127.8 111.1,118.1 111.1,111.9
  pour Top (no thermals): 132,36.6 132,37.6 140.5,37.6 140.5,36.6
  pour Top (no thermals): 89,126.1 77.5,137.6 72,137.6 72,136.6 76.7,136.6 88.2,125.1 98.8,125.1 107.5,116.4 107.5,36.6 131,36.6 131,37.6 108.5,37.6 108.5,117 99.43,126.07 98.03,126.07
  pour Top (no thermals): 5.9,46.6 11.9,46.6 11.9,41.6 5.9,41.6
  pour Top (no thermals): 19.1,64 19.1,58.6 22.8,58.6 22.8,59.7 23.3,60.2 25.9,60.2 25.9,64
  pour Top (no thermals): 12.9,57.4 12.9,54.6 17.8,54.6 17.8,57.4
  pour Top (no thermals): 22.2,124.7 38.6,124.7 38.6,134.3 35,137.9 23.6,137.9 4.1,118.4 4.1,116.6 16.5,116.6 16.5,119
  pour Top (no thermals): 22.4,86.4 22.4,82.7 26.7,82.7 26.7,86.4
  pour Top (no thermals): 114.1,110.9 114.1,109.9 114.6,109.4 116,109.4 116,108.3 117.9,108.3 117.9,113.4 116.1,113.4 116.1,111.6 115.6,111.1 114.3,111.1
  cutout Bottom: 60.5,102.1 60.5,99.1 53.5,99.1 53.5,102.1
  cutout Bottom: 88.5,102.1 88.5,99.1 81.5,99.1 81.5,102.1
  pour Top (no thermals): 25.9,60.2 30.7,60.2 31.5,61 31.5,85.4 30.5,86.4 26.7,86.4 26.7,64.8 25.9,64
  cutout Bottom (no thermals): 6.5,73.6 6.5,57.6 18.5,57.6 19.5,58.6 19.5,64.6 17.5,64.6 17.5,73.6
GND_LGC_EXT  (via drill 0.35)
  Top 0.406: C11.1 120.2,101.8 120.5,102.1 v122.2,102.1 | v126,102.1 126.1,102.2 v127.8,102.2 | v132.3,103.9 132.3,104.1 133,104.8 J3.3
  Bottom 0.406: v132.3,103.9 129.5,103.9 v127.8,102.2 126.95,103.05 C104.1 | v122.2,102.1 v126,102.1
HOLE1  (via drill 3.8 pad 7.2)
  other vias: 13.5,125.54
HOLE2  (via drill 3.8 pad 7.2)
  other vias: 127.5,125.54
HOLE3  (via drill 3.8 pad 7.2)
  other vias: 22,69.54
HOLE4  (via drill 3.8 pad 7.2)
  other vias: 119,69.54
HV_AC
  pour Top (no thermals): 22.4,109.8 31.4,109.8 34,112.4 35.2,112.4 35.2,115.3 32,115.3 29.9,113.2 22.4,113.2
HV_FB  (via drill 0.35)
  Top 0.2: v22.3,50.4 R35.1 19.25,50.95 17.83,52.37 U5.10 | v25.2,50.4 25.4,50.6 R36.2
  Bottom 0.2: v22.3,50.4 v25.2,50.4
HV_IND_HIGH
  Top 0.2: RN1.10 U4.35
HV_IND_HIGH_CL  (via drill 0.35)
  Top 0.2: D3.C 101.96,140.39 v104.9,140.39 | RN1.7 v134.4,81.4 v134.4,81.39
  Bottom 0.2: v104.9,140.39 110.52,140.39 120.48,130.43 120.48,121.55 123.15,118.88 130.2,118.88 139.44,109.65 139.44,82.35 138.48,81.39 v134.4,81.39
HV_IND_LOW
  Top 0.2: U4.33 127.48,79.8 RN1.12
HV_IND_LOW_CL  (via drill 0.35)
  Top 0.2: D5.C 103.75,141.6 v106.1,141.6 | RN1.5 134.38,79.8 v134.4,79.78
  Bottom 0.2: v106.1,141.6 110.45,141.6 121.29,130.76 121.29,121.88 123.48,119.69 130.54,119.69 140.25,109.98 140.25,82.02 138.01,79.78 v134.4,79.78
HV_IND_MAX
  Top 0.2: RN1.9 U4.36
HV_IND_MAX_CL  (via drill 0.35)
  Top 0.2: D2.C 101.06,139.78 v104.3,139.78 | RN1.8 v134.4,82.2
  Bottom 0.2: v104.3,139.78 110.55,139.78 120.08,130.26 120.08,121.38 122.98,118.47 130.03,118.47 139.03,109.48 139.03,82.52 138.71,82.2 v134.4,82.2
HV_IND_MID
  Top 0.2: RN1.11 U4.34
HV_IND_MID_CL  (via drill 0.35)
  Top 0.2: D4.C 102.85,141 v105.5,141 | RN1.6 v134.39,80.6 v134.4,80.59
  Bottom 0.2: v105.5,141 110.49,141 120.88,130.6 120.88,121.71 123.31,119.28 130.37,119.28 139.84,109.81 139.84,82.19 138.24,80.59 v134.4,80.59
HV_IND_MIN
  Top 0.2: U4.32 125.8,78 126.1,77.7 127,77.7 128.3,79 RN1.13
HV_IND_MIN_CL  (via drill 0.35)
  Top 0.2: D6.C 106.65,142.35 v106.7,142.3 | RN1.4 134.38,79 v134.4,78.98
  Bottom 0.2: v106.7,142.3 110.33,142.3 121.69,130.93 121.69,122.05 123.65,120.09 130.7,120.09 140.65,110.15 140.65,81.85 137.78,78.98 v134.4,78.98
HV_SENSE_DIV_BR
  Top 0.2: R46.1 R45.2
HVGATE
  Top 0.152: U5.15 15.08,58.92 15.08,59.42 14.72,59.78 13.5,59.78 11.6,61.68 11.6,64.27 Q7.1
KICK  (via drill 0.35)
  Top 0.2: v133,85.4 U4.40 | R27.2 v137.3,83.6 | v104.9,139.18 v100.59,134.88 | v100.6,131.5 U1.4
  Bottom 0.2: 137.3,85.4 137.4,85.4 138.6,86.6 138.6,109.34 129.87,118.07 122.73,118.07 119.64,121.16 119.64,130.06 110.52,139.18 v104.9,139.18 | 137.3,85.4 v133,85.4 | v137.3,83.6 137.3,85.4 | v100.59,134.88 v100.59,131.5 v100.6,131.5
KICK_GATE
  Top 0.61: U1.5 91.9,133.25 | R6.2 91.9,136.95 91.9,133.25 | R8.1 91.88,133.28 91.9,133.25
KICK_GATE_S  (via drill 0.35)
  Top 0.406: v87,125.3 87,122.6 89,120.6 100.5,120.6 101.5,119.6 104.5,116.6 104.5,113.6 103.5,112.6 93.31,112.6 Q6.G_BOT | R8.2 90.1,138.1 v90.4,138.4
  Bottom 0.406: v87,125.3 86.8,125.3 76,136.1 71.5,136.1 71,136.6 71,137.6 71.5,138.1 89.8,138.1 89.95,137.95 | 89.95,137.95 90.1,137.8 D100.2 | v90.4,138.4 89.95,137.95
  Bottom 0.61: C108.1 90.36,136 D100.2
KICKER
  Top 3.5: Q6.C_BOT 90.5,117.6 86.5,113.6 J100.2
  pour Top (no thermals): 96,113.1 94,115.1 92,115.1 91,116.1 91,117.6 91,119.1 91.5,119.6 94,119.6 97,116.6 101.5,116.6 102,116.1 102,113.6 101.5,113.1
MCU_ERR  (via drill 0.35)
  Top 0.2: U4.25 v120.2,77.6 v120.19,77.6 | v127,75.7 128,75.7 128.9,76.6 RN1.16
  Bottom 0.2: v120.19,77.6 120.4,77.4 120.4,77.35 121.42,76.32 122.04,75.7 v127,75.7
MCU_ERR_CL
  Top 0.152: D20.C 135.9,83.75 135.9,78.49 134.01,76.6 RN1.1
MCU_INIT_OK  (via drill 0.35)
  Top 0.2: U4.30 v124.2,77.6 | v125.8,77.09 127.4,77.09 128.5,78.2 RN1.14
  Bottom 0.2: v124.2,77.6 124.7,77.09 v125.8,77.09
MCU_INIT_OK_CL
  Top 0.152: RN1.3 134.6,78.2 135.1,78.7 135.1,83 134.6,83.5 D18.C
MCU_MODE  (via drill 0.35)
  Top 0.2: U4.26 v121,77.6 | v126.4,76.39 126.51,76.4 127.8,76.4 128.7,77.4 RN1.15
  Bottom 0.2: v121,77.6 122.21,76.39 v126.4,76.39
MCU_MODE_CL
  Top 0.152: D19.C 135.5,85.35 135.5,78.59 134.31,77.4 RN1.2
MISO  (via drill 0.35)
  Top 0.2: U4.2 125.8,91.9 123.45,94.25 123.45,96.55 v123.5,96.6 | v129.5,99.5 129.7,99.7 130.46,99.7 130.64,99.88 130.64,101.14 130.46,101.32 129.67,101.32 U3.11
  Bottom 0.2: v123.5,96.6 125.9,98.99 125.9,99.11 126.25,99.46 127.04,99.46 127.25,99.25 127.75,99.25 128,99.5 v129.5,99.5
MISO_EXT  (via drill 0.35)
  Top 0.2: v121.29,103.6 122.72,105.03 122.72,105.04 127.48,109.8 J3.8 | v122.4,101.2 122.78,101.2 123.06,101.48 U3.6
  Bottom 0.2: v121.29,103.6 121.49,103.4 121.49,101.95 122.24,101.2 v122.4,101.2
MODE_SELECT  (via drill 0.35)
  Top 0.2: U4.19 111,83 109.2,84.8 v109.2,88.6 | v113.1,98.3 123.75,108.95 R18.2
  Bottom 0.2: v109.2,88.6 109.2,95.7 109.8,96.3 110.14,96.3 110.15,96.29 111.55,96.29 111.56,96.3 111.94,96.3 111.95,96.29 112.45,96.29 113.1,96.94 v113.1,98.3
MOSI  (via drill 0.35)
  Top 0.2: U4.1 126.6,91.8 124.15,94.25 124.31,94.41 124.31,95.98 124.5,96.17 v124.5,96.6 | U3.12 129.33,101.97 128.53,101.97 127.81,101.24 127.28,101.24 126.5,100.46 v126.5,98.86
  Bottom 0.2: v124.5,96.6 124.5,96.86 v126.5,98.86
MOSI_EXT  (via drill 0.35)
  Top 0.2: J3.7 v129.9,108.8 | U3.5 124.76,102.13 v125.5,101.39
  Bottom 0.2: v125.5,101.39 125.6,101.5 126.25,101.5 126.6,101.85 126.6,102.35 125.96,103 122.25,103 121.9,103.35 121.9,103.85 126.25,108.2 129.31,108.2 v129.9,108.8
N$1
  Top 0.152: R33.1 14.45,57.95 14.58,58.07 U5.16
N$2
  Top 0.2: R37.2 R36.1
N$3
  Top 0.3: D22.A 25.95,46.17 28.2,46.17 R43.1 28.1,48.07 23.91,48.07 D21.A
N$5
  Top 0.2: R2.1 82.95,143.25 D1.A
N$6  (via drill 0.35)
  Top 0.2: F1.1 102.65,133.6 v101.81,133.6 | v101.14,128.4 101.11,128.37 101.11,127.23 100.37,126.5 97.33,126.5 95.47,128.36 v95.19,128.36
  Bottom 0.2: v101.81,133.6 101.81,129.07 v101.14,128.4 | v95.19,128.36 94.19,129.35 R106.2
  Bottom 0.61: U100.5 94.1,129.45 R106.2
N$7  (via drill 0.35)
  Top 0.2: F2.1 111.5,102.16 111.5,101.55 111.85,101.19 112.35,101.19 112.95,101.8 112.95,105.2 U2.789 113.65,107.6 v113.5,107.6 | v110.5,112.6 110.5,111.7 R17.2
  Bottom 0.2: v113.5,107.6 110.5,110.6 v110.5,112.6
N$14
  Top 0.2: R18.1 133,118.6 S1.3
N$16
  Bottom 0.61: R106.1 94.1,127.55 U100.4 91.8,127.55 R107.2
N$18
  Top 0.152: R26.2 3.4,85.95 C18.1
N$19
  Top 0.2: Q4.3 108.6,124.5 109.2,125.1 110.5,126.4 110.5,130.37 J2.2
N$20
  Top 0.2: R15.1 116.25,115.55 115.9,115.9 D14.A
N$24
  Top 0.152: U5.1 10.45,51.7 6.25,51.7 4.6,50.05 R38.1
N$27
  Top 0.2: R4.1 82.05,141.2 D8.A
N$28
  Top 0.2: D8.C 81.65,140.1 87,140.1 87.7,140.8 Q1.3
N$29
  Top 0.2: 76.2,131.35 R9.1 | D10.A 75.6,130.75 76.2,131.35 | D9.A 76.2,131.35
N$37
  Top 0.2: D1.C 80.45,144.2 76.4,144.2 Q3.3
N$39
  Top 0.406: XF1.2 58.63,136.89 63.79,136.89 64.21,137.31 64.21,137.89 63.79,138.31 62.79,138.31 J1.2
  pour Top (no thermals): 58.7,135.8 54.7,135.8 53.8,134.9 53.8,129.7 54.4,129.1 58.1,129.1 62.46,133.46 62.43,140.37 62.27,140.53 60.5,140.53 60.4,140.43 60.4,137.5
OVLO1
  Top 0.152: U5.3 13.13,53.08 13.13,52.58 11.53,50.98 9.83,50.98 R40.2
OVLO2
  Top 0.152: U5.5 14.58,50.77 13.9,50.1
  Top 0.2: 13.9,50.1 R42.2
QD_GATE_CTRL
  Bottom 0.2: R109.1 62.4,132.6 | 62.4,132.6 R110.2 | Q101.1 62.45,132.65 62.4,132.6
QD_PU_BR
  Bottom 0.2: R104.1 R108.2
QUICK_DISCHARGE
  Bottom 0.152: R105.2 C105.2
  Bottom 0.2: Q100.1 68.25,131.55 R108.1 64.45,129.05 63.5,128.1 C105.2 | Q101.3 68.5,133.6
  pour Bottom (no thermals): 68.5,135.1 70.5,135.1 70.75,134.85 70.75,129.1 70.5,128.85 68.5,128.85 68.25,129.1 68.25,134.85
RDCM
  Top 0.152: R31.2 7.9,60.15 8.43,59.62 11.13,59.62 U5.20
REG_AAM  (via drill 0.35)
  Top 0.203: U2.18 112.2,110.5 v111.5,110.5
  Bottom 0.203: v111.5,110.5 111.65,110.65 R100.2
REG_EN
  Top 0.2: U2.17 112.75,111.05 111.8,112 R16.2
RVOUT
  Top 0.152: U5.18 13.13,58.92 13.13,59.42 12,60.55 R32.2
SCK  (via drill 0.35)
  Top 0.2: U4.3 v125,91.7 | v125,94.4 124.72,94.68 124.72,95.82 v125.5,96.6 | U3.13 129.67,102.62 130.46,102.62 131.24,101.84 131.24,99.61 v130.4,98.76
  Bottom 0.2: v125,91.7 v125,94.4 | v125.5,96.6 127.66,98.76 v130.4,98.76
SCK_EXT  (via drill 0.35)
  Top 0.2: J3.6 130.5,107.8 129.8,107.8 127.7,107.8 v127.5,107.6 | U3.4 126.96,102.78 v127.66,103.49
  Bottom 0.2: v127.66,103.49 127.66,104.23 127.81,104.37 127.81,105.63 127.35,106.08 127.35,106.59 127.5,106.74 v127.5,107.6
UVLO1
  Top 0.152: U5.2 12.48,53.08 12.48,52.58 11.24,51.34 8.39,51.34 7.18,50.12 6.47,50.12
  Top 0.2: 6.47,50.12 R39.2
UVLO2
  Top 0.152: U5.4 13.92,51.92 12.05,50.05 R41.2
V+  (via drill 0.35, 0.75 pad 0.75)
  Top 0.152: R46.2 131.45,33.73 C33.+ | C32.+ 30.15,32.68 33.83,36.36 33.83,49.84 33.49,50.18 31.92,50.18 31.58,50.52
  Top 0.2: v73.5,111.1 65.75,118.85 65.75,120.6 | 65.75,120.6 v65.75,120.74 | R9.2 78.5,129.35 78.5,124.6 75.5,121.6 66.75,121.6 65.75,120.6 | R37.1 31.58,50.52 31.58,44.67 29,42.1 v24.5,42.1
  Top 0.3: v24.5,42.1 27.57,45.17 R43.2
  Bottom 0.2: v65.75,120.74 R104.2
  other vias: 74,110.35 74.5,111.1 75.25,110.35 76,111.1 76.5,110.35 77,111.1
  pour Top (no thermals): 50.5,110.6 34.5,110.6 34.5,35.4 43.5,35.4 43.5,87.33 97.5,87.33 97.5,11.1 105,3.6 109.52,3.6 134.51,29.63 134.48,32.62 131.3,35.8 106.7,35.8 106.7,110.6 106.2,111.1 100.5,111.1 99.5,112.1 96,112.1 95.5,111.6 95.5,108.6 78.5,108.6 77.5,109.6 77.5,111.1 77,111.6 73.5,111.6 73,111.1 73,109.6 72,108.6 56,108.6 55.5,109.1 55.5,111.6 55,112.1 52,112.1
  pour Top (no thermals): 5.9,33.3 8,35.4 43,35.4 43,9.8 36.3,3.1 33.76,3.1 5.9,32.2
  pour Bottom (no thermals): 73,115.2 78,115.2 78,110.6 77.25,109.85 73.25,109.85 73,110.1
VBATT  (via drill 0.35, 0.75 pad 0.75)
  Top 0.152: C18.2 0.75,89.15 0.7,89.2 | C4.1 53.09,122.71 53.4,122.4 | D12.C 55.35,124.35 | v63.4,130.3 62.56,131.14 62.14,131.14
  Top 0.2: R39.1 R40.1 | R42.1 R41.1 | XF1.3 39.5,137.16 | v39.5,141.1 39.5,137.16 | R5.2 38.91,137.75 39.5,137.16
  Top 0.254: C9.1 113.25,111.65 U2.16
  Top 0.3: v14.5,40.6 13.8,41.3 C31.1
  Top 0.305: U5.14 15.88,58.12 16.15,57.85 16.6,57.85 | 16.6,57.85 19.4,57.85 C24.1 | U5.13 16.52,57.92 16.6,57.85
  Top 0.61: R38.2 3.16,48.89 2.94,48.89 0.7,51.13 0.7,89.2 0.7,109.8 C5.1 | R42.1 14.64,48.89 14.86,48.89 14.87,48.9 22.3,48.9 25.7,52.3 25.7,54.6 23.1,54.6 C27.1 | v66.84,140.96 66.14,140.26 66.14,139.95 66.14,135.14 62.14,131.14 55.35,124.35 53.4,122.4 | C9.1 114.1,113.9 113.25,114.75 R16.1 111.75,114.7 v109.8,114.7 | C4.1 51.88,121.6 24.7,121.6 C3.+
  Bottom 0.152: R109.2 62.45,130.3 v63.4,130.3
  Bottom 0.2: U100.1 99.54,129.45 99.69,129.3
  Bottom 0.3: v14.5,40.6 C103.1 17.45,39.7 17.74,39.4 19.95,39.4 20.16,39.2 20.16,39.19 C102.1 22.05,38.3 23.15,39.4 24.75,39.4 24.95,39.2 24.95,39.19 C101.1 26.95,38.3 27.75,37.49 29.35,37.49 29.55,37.7 C100.1
  Bottom 0.61: 99.69,127.56 99.69,129.3 99.69,136.66 95.41,140.94 v66.84,140.96 | 99.69,127.56 109.8,117.45 v109.8,114.7 | U100.3 99.68,127.55 99.69,127.56
  pour Top (no thermals): 2.9,49.1 14.9,49.1 14.9,41.6 12.4,41.6 12.4,47.1 5.4,47.1 5.4,41.6 2.9,41.6
  pour Bottom (no thermals): 97.7,132 97.7,129.1 99.9,129.1 99.9,132
  pour Top (no thermals): 19.1,58 19.1,55.2 20,54.3 26,54.3 26,59.2 23.3,59.2 23.2,59.1 23.2,58
  pour Top (no thermals): 4.1,115.4 17.8,115.4 17.8,109.7 4.4,109.7 4.1,109.7
  pour Top (no thermals): 22.6,123.9 39.6,123.9 39.6,120.8 36,120.8 29.3,114.1 19.2,114.1 18.7,113.6 18.7,109.7 16.7,109.7 16.6,109.8 16.6,115.4 17.2,116 17.2,118.5
  pour Top (no thermals): 39.3,120.8 45.5,120.8 45.5,134.4 44,135.9 40.9,135.9 39.3,134.3
VCC_LGC_EXT  (via drill 0.35)
  Top 0.2: v122.5,103.6 122.98,104.08 U3.2
  Top 0.4: J3.2 135.55,103.59 134.24,102.27 134.24,98.79 133.5,98.06 128.89,98.06 128.79,98.16 121.19,98.16 C11.2 121.23,100.19 U3.8
  Top 0.406: C11.2 119.95,99.15 119.29,99.81 119.29,101.76 120.25,102.71 121.61,102.71 v122.5,103.6
  Bottom 0.406: C104.2 123.85,103.6 v122.5,103.6
VMON  (via drill 0.35)
  Top 0.15: D23.C1 122.85,41.15 R44.2
  Top 0.2: R44.2 R45.1 125,42.55 | 125,42.55 v125,40.6 | U4.31 125,42.55
VSN
  Top 0.152: 10.59,77.84 Q7.2 | R32.1 R31.1 7.9,73.6 | T1.7 7.64,85 R26.1
  pour Top (no thermals): 6.2,73.3 17.8,73.3 17.8,86.2 7.5,86.2 7.5,83.6 6.2,82.3

## Text on the board
tPlace: CHG LEVEL | CHARGE | +VBATT | +5V | BB POT | FAULT | GND | LT3751 | AUTO / DSCHG | BREAKBEAM | BALL | DBG | 15V | 5V | NORM | HV AC | HIGH VOLTAGE | MCU | HIGH VOLTAGE | HIGH VOLTAGE | CHIP | ID | Kicker / RoboJackets / Mar. 2022 | KICK | CHARGE | +HV | HIGH VOLTAGE | HIGH VOLTAGE
bPlace: > | > | HIGH VOLTAGE | CHIPPER | KICKER | HIGH VOLTAGE | HIGH VOLTAGE | HIGH VOLTAGE | HIGH VOLTAGE